# Altium schematic sheet rf.SchDoc: RF
size A4; CompanyName: AGH University of Krakow; Engineer: Jakub Kwiecień; Revision: 1; SheetNumber: 2; SheetTotal: 4
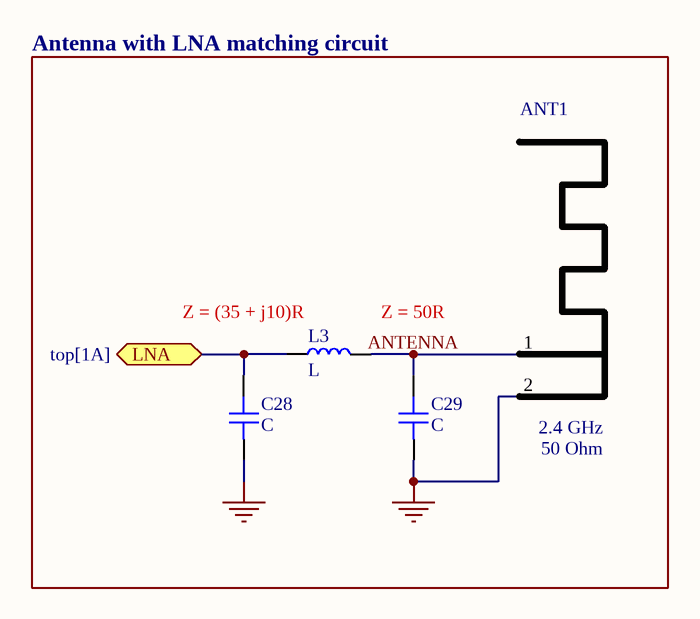
[diagram p0: rf.SchDoc]

## Parts
ANT1  PCB_Antenna  [ANT_PIFA_2_4GHZ_50R_WS]  (value not drawn)
C28  C  [CAP_0603]
C29  C  [CAP_0603]
L3  L  [L_0603]

## Ports
LNA (bidir, see top[1A])

## Nets
GND: ANT1.2(GND) C28.1 C29.1
ANTENNA: ANT1.1(FEED) C29.2 L3.2
LNA: C28.2 L3.1 ; port LNA

## Notes on the sheet
- Antenna with LNA matching circuit
- (near L3) Z = (35 + j10)R
- (near L3) Z = 50R
- Project name:
- Title:
- Company:
- Engineer:
- Modified:
- Revision:
- (in symbol ANT_PIFA_2_4GHZ_50R) 2.4 GHz; 50 Ohm

## Library data of the parts
ANT1 = ANT_PIFA_2_4GHZ_50R: PCB 2.4 GHz 50 Ohm antenna; ComponentLink1Description: Datasheet; ComponentLink1URL: *
C28 C29 = CAP_0603: Capacitor SMD 0603; Manufacturer: *; Manufacturer Part Number: *; ComponentLink1Description: Distributor Link; ComponentLink1URL: *
L3 = L_603: Inductor SMD 0603; Manufacturer: *; Manufacturer Part Number: *; ComponentLink1Description: Distributor Link; ComponentLink1URL: *